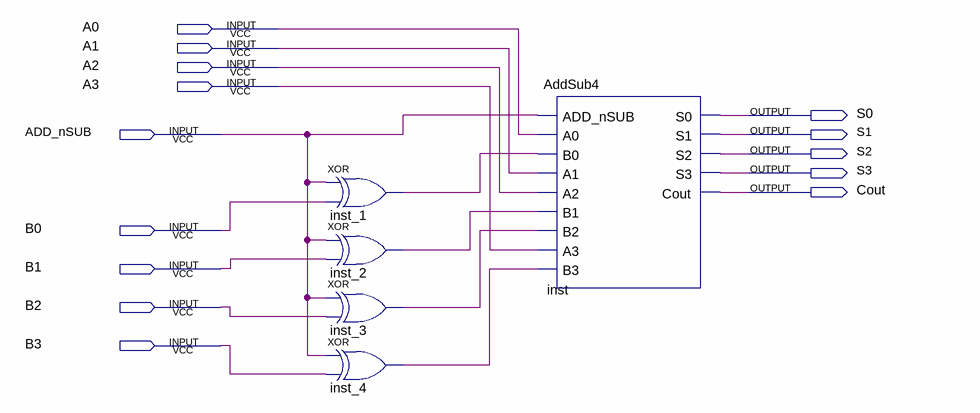
[diagram p0: schematic sheet]
// Quartus schematic AddSubDemo.bdf as structural Verilog: 5 symbols, 14 pins
module AddSubDemo (
  input  A0,
  input  A1,
  input  A2,
  input  A3,
  input  ADD_nSUB,
  input  B0,
  input  B1,
  input  B2,
  input  B3,
  output S0,
  output S1,
  output S2,
  output S3,
  output Cout
);

  wire inst_1_out, inst_2_out, inst_3_out, inst_4_out;

  xor inst_1 (inst_1_out, ADD_nSUB, B0);
  xor inst_2 (inst_2_out, ADD_nSUB, B1);
  xor inst_3 (inst_3_out, ADD_nSUB, B2);
  xor inst_4 (inst_4_out, ADD_nSUB, B3);
  AddSub4 inst (
    .ADD_nSUB(ADD_nSUB), .A0(A0), .B0(inst_1_out), .A1(A1), .A2(A2), .B1(inst_2_out), .B2(inst_3_out),
    .A3(A3), .B3(inst_4_out), .S0(S0), .S1(S1), .S2(S2), .S3(S3), .Cout(Cout));
endmodule
